# Altium schematic sheet Variklis.SchDoc
size A4; SheetNumber: 5; SheetTotal: 6
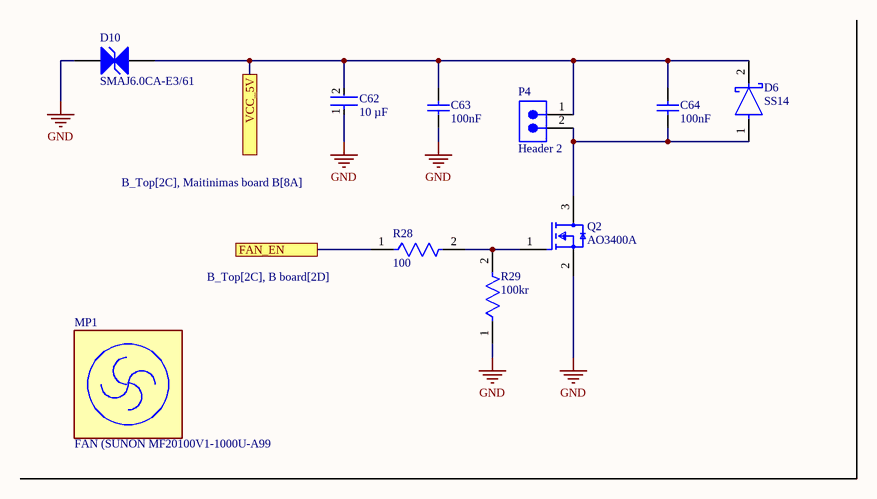
[diagram p0: Variklis.SchDoc]

## Parts
C62  10 µF  [FP-GQM219-0_15-IPC_B]
C63  100nF  [CAPC1608X92X38ML15T08]
C64  100nF  [CAPC1608X92X38ML15T08]
D6  SS14  [FP-403AE-MFG]
D10  SMAJ6.0CA-E3/61  [VISH-DO-214AC-2_L]
MP1  FAN (SUNON MF20100V1-1000U-A99  [FP-CFM-6015V-154-362-MFG]
P4  Header 2  [SMTC-TSW-102-22-X-S-RA]
Q2  AO3400A  [FP-SOT23-MFG]
R28  100  [FP-MCT0603-MFG]
R29  100kr  [FP-MCT0603-IPC_C]

## Ports
FAN_EN (see B_Top[2C], B board[2D]), VCC_5V (see B_Top[2C], Maitinimas board B[8A])

## Nets
GND: C62.1 C63.1 D10.1(A1) Q2.2(S) R29.1
FAN_EN: R28.1 ; port FAN_EN
VCC_5V: C62.2 C63.2 C64.2 D6.2(C) D10.2(A2) P4.1 ; port VCC_5V
NetC64_1: C64.1 D6.1(A) P4.2 Q2.3(D)
NetQ2_1: Q2.1(G) R28.2 R29.2

## Library data of the parts
C62 = CMP-06035-028339-1: Ceramic Capacitor 91pF ±1% 250VDC C0G 0805 Paper T/R
C63 C64 = CMP-2006-01140-1: Part Number: VJ0603Y104MXXAC; Manufacturer: Vitramon
D6 = CMP-2000-04943-2: DIODE SCHOTTKY 40V 1A SMA; Manufacturer: ON Semiconductor; Peak Reverse Current: 0.2mA; Max Junction Temp: +125°C; Standoff Height: 0.05mm; Max Surge Forward Current: 40A; Mouser Description: Schottky Diodes & Rectifiers SMA 40V 1.0A; RoHS: TRUE; Lead Free: Yes; Manufacturer Part Number: SS14; Device Class L3: Schottky Diodes; Category: Diode; Automotive: No; Digikey Description: DIODE SCHOTTKY 40V 1A SMA; ComponentLink2Description: Datasheet; Device Class L2: Diodes; Height: 2.5mm; Temperature Range High: +125°C; ComponentLink2URL: https://www.onsemi.com/pub/Collateral/SS19-D.PDF; Device Class L1: Discrete Semiconductors; Package: 403AE; Octopart: https://octopart.com/ss14-on+semiconductor-29205033; Max Repetitive Reverse Voltage: 40V; Temperature Range Low: -65°C; Forward Current: 1A; Temperature: -65°C to +125°C
D10 = CMP-0548-00193-2: Transient Voltage Suppressor, 6.40 to 231 V, 6 V Stand-off Voltage, Bi-Directional, -55 to 155 degC, 2-pin DO-214AC, Pb-Free, Tape and Reel; Manufacturer: Vishay Semiconductor; VWM (V): 6; IFSM: 40 A; VBR Bi-Directional (V): 6.4 to 231; ID (uA): 1600; PPPM (W): 400, 300; ComponentLink1URL: http://www.vishay.com/; ComponentLink1Description: Manufacturer URL; Packing: Tape and Reel; PackageReference: DO-214AC-2; ComponentLink2URL: http://www.vishay.com/docs/88390/smaj50a.pdf; RoHS: TRUE; Operating Junction and Storage Temperature Range: -55 to 150 degC; Mounting Technology: Surface Mount; PackageDescription: 2-Pin DO-214AC (SMA), Body 4.245 x 2.665 mm; ComponentLink3URL: http://www.vishay.com/docs/88390/smaj50a.pdf; PartNumber: SMAJ6.0CA-E3/61; DatasheetVersion: 12/8/2013; ComponentLink3Description: Package Specification; ComponentLink2Description: Datasheet
MP1 = CMP-12637-106233381-1: CFM-6015V-154-362 DC Fan Axial omniCOOL Bearing 12V 4.5V to 13.8V 30.4CFM 36.2dB 60 X 60 X 15mm; Max Input Current: 213mA; RoHS: Non-Compliant; Airflow: 30.4CFM; Lifecycle Status: Production; Length: 60mm; Schedule B: 8414599080; Max Operating Temperature: 70°C; NexarPartId: 106233381; Width: 60mm; Voltage Rating: 12V; Height: 15mm; Min Operating Temperature: -10°C
P4 = CMP-1024-00324-1: 0.025" SQ Post Header, Through-hole, Right Angle, -55 to 105 degC, 2.54 mm Pitch, 2-Pin, Male, RoHS; PartNumber: TSW-102-22-T-S-RA; Manufacturer: Samtec; Pitch: 2.54 mm; RoHS: True; ComponentLink1URL: http://www.samtec.com; Temperature Range: -55 to 105 degC; DatasheetVersion: F-214; ComponentLink3Description: Package Specification; ComponentLink2URL: http://www.samtec.com/documents/webfiles/pdf/TSW_TH.PDF; ComponentLink3URL: http://www.samtec.com/documents/webfiles/cpdf/TSW-XXX-XX-XXX-X-XX-XXX-MKT.pdf; ComponentLink1Description: Manufacturer URL; PackageVersion: DM, 8/1988; PackageDescription: .025[0.64] SQ. Post Terminal Strip Assembly; ComponentLink2Description: Datasheet; Mounting Technology: Through-hole; Orientation: Right Angle; PackageReference: TSW-102-22-X-S-RA
Q2 = CMP-83955-000006-1: MOSFET N-CH 30V 5.7A SOT23; Input Capacitance: 630pF; Number of Elements: 1; Rds On Max: 26.5mR; Max Power Dissipation: 1.4W; Gate to Source Voltage (Vgs): 12V; Min Operating Temperature: -55°C; Lead Free: Lead Free; Number of Pins: 3; Drain to Source Voltage (Vdss): 30V; Case/Package: SOT-23; Mount: Surface Mount; Continuous Drain Current (ID): 5.7A; Radiation Hardening: No; Packaging: Tape and Reel; Max Operating Temperature: 150°C; Power Dissipation: 1.4W
R28 = CMP-02407-008087-1: RES SMD 100 OHM 1% 1/8W 0603; Power Rating: 125mW; Voltage Rating: 75V; Resistance: 100R; Max Operating Temperature: 175°C; Case Code (Imperial): 0603; Height: 0.45mm; Packaging: Tape and Reel; Min Operating Temperature: -55°C; Termination: SMD/SMT; Case/Package: 0603; Case Code (Metric): 1608; Width: 0.85mm; Length: 1.55mm; Tolerance: 1%; Composition: Thin Film; Weight: 6.7E-05oz
R29 = CMP-02407-008119-1: RES SMD 100 OHM 1% 1/8W 0603; Voltage Rating: 75V; Power Rating: 125mW; Length: 1.55mm; Packaging: Tape and Reel; Width: 0.85mm; Case Code (Metric): 1608; Weight: 6.7E-05oz; Tolerance: 1%; Height: 0.45mm; Resistance: 100kR; Case Code (Imperial): 0603; Max Operating Temperature: 175°C; Case/Package: 0603; Min Operating Temperature: -55°C; Composition: Thin Film